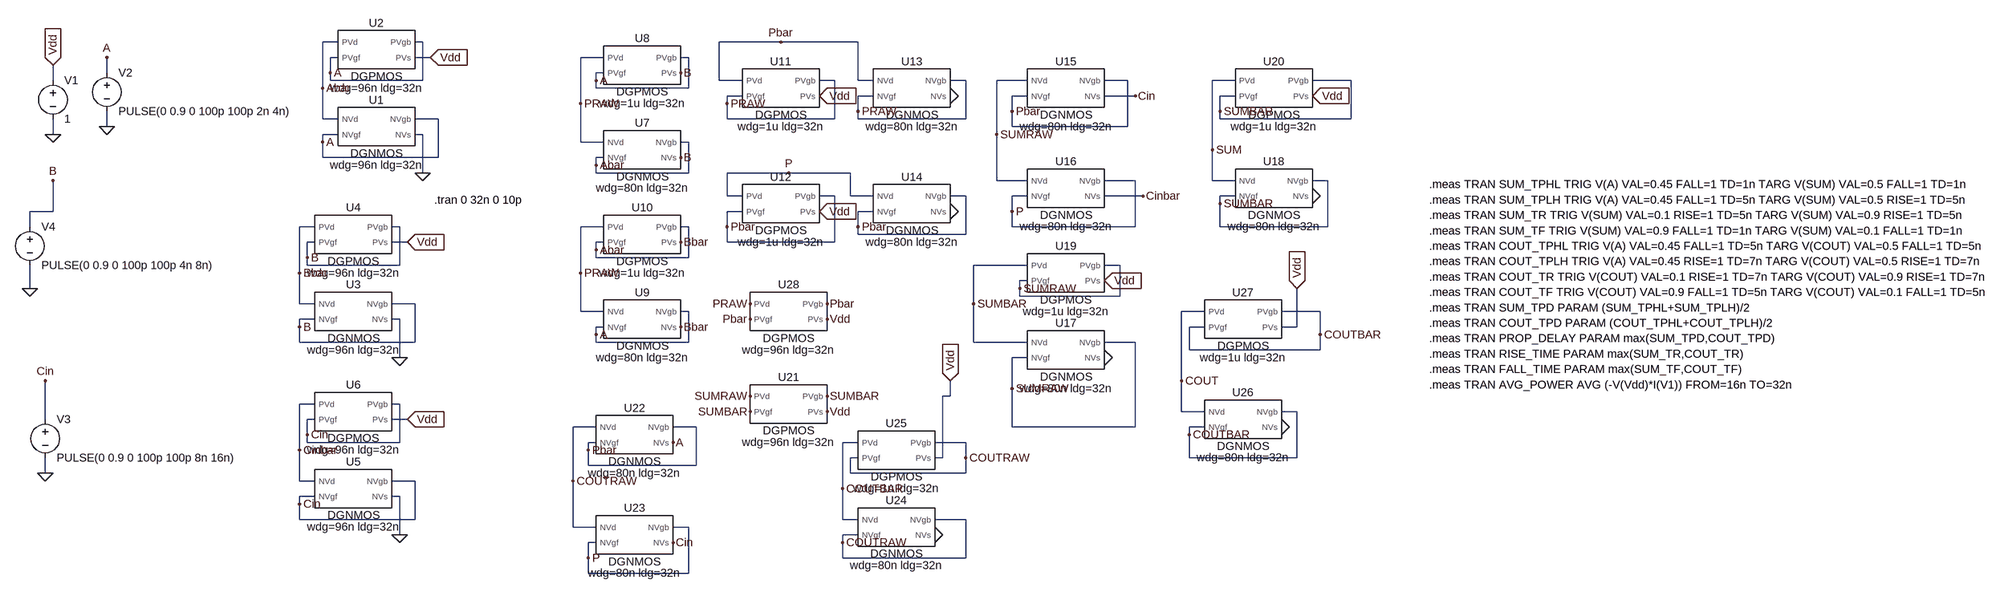
[diagram p0: schematic TG_PASS_FinFET.asc]
TG_PASS_FinFET.asc, the LTspice schematic file:
Version 4
SHEET 1 2736 1444
WIRE -2144 80 -2176 80
WIRE -1968 80 -1984 80
WIRE -944 80 -1072 80
WIRE -784 80 -944 80
WIRE -2144 112 -2160 112
WIRE -1952 112 -1984 112
WIRE -1312 112 -1360 112
WIRE -1136 112 -1152 112
WIRE -2624 144 -2624 112
WIRE -2160 144 -2160 112
WIRE -1312 144 -1328 144
WIRE -2736 160 -2736 128
WIRE -2160 160 -2160 144
WIRE -1968 160 -1968 80
WIRE -1968 160 -2160 160
WIRE -1328 160 -1328 144
WIRE -1072 160 -1072 80
WIRE -1024 160 -1072 160
WIRE -832 160 -864 160
WIRE -784 160 -784 80
WIRE -752 160 -784 160
WIRE -560 160 -592 160
WIRE -432 160 -496 160
WIRE -224 160 -272 160
WIRE 0 160 -48 160
WIRE 240 160 160 160
WIRE -2176 176 -2176 80
WIRE -1328 176 -1328 160
WIRE -1136 176 -1136 112
WIRE -1136 176 -1328 176
WIRE -1024 192 -1056 192
WIRE -752 192 -784 192
WIRE -432 192 -464 192
WIRE -208 192 -272 192
WIRE 0 192 -32 192
WIRE -1360 208 -1360 112
WIRE -1056 208 -1056 192
WIRE -784 224 -784 192
WIRE -464 224 -464 192
WIRE -32 224 -32 192
WIRE -2176 240 -2176 176
WIRE -2144 240 -2176 240
WIRE -1936 240 -1984 240
WIRE -1056 240 -1056 208
WIRE -832 240 -832 160
WIRE -832 240 -1056 240
WIRE -784 240 -784 224
WIRE -560 240 -560 160
WIRE -560 240 -784 240
WIRE -32 240 -32 224
WIRE 240 240 240 160
WIRE 240 240 -32 240
WIRE -2624 256 -2624 224
WIRE -464 256 -464 224
WIRE -224 256 -224 160
WIRE -224 256 -464 256
WIRE -2736 272 -2736 240
WIRE -2144 272 -2176 272
WIRE -1968 272 -1984 272
WIRE -496 272 -496 160
WIRE -2176 288 -2176 272
WIRE -1360 288 -1360 208
WIRE -1312 288 -1360 288
WIRE -1136 288 -1152 288
WIRE -48 304 -48 160
WIRE -2176 320 -2176 288
WIRE -1936 320 -1936 240
WIRE -1936 320 -2176 320
WIRE -1312 320 -1328 320
WIRE -1328 336 -1328 320
WIRE -1968 352 -1968 272
WIRE -1328 352 -1328 336
WIRE -1136 352 -1136 288
WIRE -1136 352 -1328 352
WIRE -928 352 -1056 352
WIRE -800 352 -928 352
WIRE -496 368 -496 272
WIRE -432 368 -496 368
WIRE -208 368 -272 368
WIRE -48 368 -48 304
WIRE 0 368 -48 368
WIRE 192 368 160 368
WIRE -1056 400 -1056 352
WIRE -1024 400 -1056 400
WIRE -832 400 -864 400
WIRE -800 400 -800 352
WIRE -752 400 -800 400
WIRE -560 400 -592 400
WIRE -432 400 -464 400
WIRE -192 400 -272 400
WIRE 0 400 -32 400
WIRE -32 416 -32 400
WIRE -2736 432 -2736 368
WIRE -2736 432 -2784 432
WIRE -1024 432 -1056 432
WIRE -752 432 -784 432
WIRE -464 432 -464 400
WIRE -2784 464 -2784 432
WIRE -2192 464 -2224 464
WIRE -2016 464 -2032 464
WIRE -1312 464 -1360 464
WIRE -1136 464 -1152 464
WIRE -1056 464 -1056 432
WIRE -784 464 -784 432
WIRE -464 464 -464 432
WIRE -208 464 -208 368
WIRE -208 464 -464 464
WIRE -32 464 -32 416
WIRE 192 464 192 368
WIRE 192 464 -32 464
WIRE -784 480 -784 464
WIRE -560 480 -560 400
WIRE -560 480 -784 480
WIRE -2192 496 -2208 496
WIRE -2000 496 -2032 496
WIRE -1312 496 -1328 496
WIRE -1056 496 -1056 464
WIRE -832 496 -832 400
WIRE -832 496 -1056 496
WIRE -1328 512 -1328 496
WIRE -2208 528 -2208 496
WIRE -1328 528 -1328 512
WIRE -1136 528 -1136 464
WIRE -1136 528 -1328 528
WIRE -2208 544 -2208 528
WIRE -2016 544 -2016 464
WIRE -2016 544 -2208 544
WIRE -432 544 -544 544
WIRE -240 544 -272 544
WIRE -2224 560 -2224 464
WIRE -1360 560 -1360 464
WIRE -432 576 -448 576
WIRE -2784 592 -2784 544
WIRE -448 592 -448 576
WIRE -448 608 -448 592
WIRE -240 608 -240 544
WIRE -240 608 -448 608
WIRE -2224 624 -2224 560
WIRE -2192 624 -2224 624
WIRE -1984 624 -2032 624
WIRE -544 624 -544 544
WIRE -1360 640 -1360 560
WIRE -1312 640 -1360 640
WIRE -1136 640 -1152 640
WIRE -64 640 -112 640
WIRE 176 640 96 640
WIRE -2192 656 -2224 656
WIRE -2016 656 -2032 656
WIRE -2224 672 -2224 656
WIRE -1312 672 -1328 672
WIRE -64 672 -96 672
WIRE 128 672 128 592
WIRE 128 672 96 672
WIRE -1328 688 -1328 672
WIRE 176 688 176 640
WIRE -2224 704 -2224 672
WIRE -1984 704 -1984 624
WIRE -1984 704 -2224 704
WIRE -1328 704 -1328 688
WIRE -1136 704 -1136 640
WIRE -1136 704 -1328 704
WIRE -544 704 -544 624
WIRE -432 704 -544 704
WIRE -208 704 -272 704
WIRE -96 720 -96 672
WIRE 176 720 176 688
WIRE 176 720 -96 720
WIRE -2016 736 -2016 656
WIRE -432 736 -464 736
WIRE -112 784 -112 640
WIRE -464 800 -464 736
WIRE -592 816 -592 784
WIRE -592 816 -608 816
WIRE -2192 832 -2224 832
WIRE -2016 832 -2032 832
WIRE -112 848 -112 784
WIRE -64 848 -112 848
WIRE 128 848 96 848
WIRE -2752 864 -2752 784
WIRE -2192 864 -2208 864
WIRE -2000 864 -2032 864
WIRE -1328 880 -1376 880
WIRE -1120 880 -1168 880
WIRE -464 880 -464 800
WIRE -208 880 -208 704
WIRE -208 880 -464 880
WIRE -64 880 -96 880
WIRE -2208 896 -2208 864
WIRE -96 896 -96 880
WIRE -2208 912 -2208 896
WIRE -2016 912 -2016 832
WIRE -2016 912 -2208 912
WIRE -1328 912 -1344 912
WIRE -784 912 -816 912
WIRE -560 912 -624 912
WIRE -2224 928 -2224 832
WIRE -1344 928 -1344 912
WIRE -784 944 -800 944
WIRE -608 944 -608 816
WIRE -608 944 -624 944
WIRE -560 944 -560 912
WIRE -96 944 -96 896
WIRE 128 944 128 848
WIRE 128 944 -96 944
WIRE -1344 960 -1344 928
WIRE -1120 960 -1120 880
WIRE -1120 960 -1344 960
WIRE -2752 976 -2752 944
WIRE -800 976 -800 944
WIRE -560 976 -560 944
WIRE -560 976 -800 976
WIRE -2224 992 -2224 928
WIRE -2192 992 -2224 992
WIRE -1984 992 -2032 992
WIRE -1376 992 -1376 880
WIRE -816 1008 -816 912
WIRE -2192 1024 -2224 1024
WIRE -2016 1024 -2032 1024
WIRE -2224 1040 -2224 1024
WIRE -2224 1072 -2224 1040
WIRE -1984 1072 -1984 992
WIRE -1984 1072 -2224 1072
WIRE -816 1072 -816 1008
WIRE -784 1072 -816 1072
WIRE -560 1072 -624 1072
WIRE -1376 1088 -1376 992
WIRE -1328 1088 -1376 1088
WIRE -1136 1088 -1168 1088
WIRE -2016 1104 -2016 1024
WIRE -784 1104 -816 1104
WIRE -1328 1120 -1344 1120
WIRE -816 1120 -816 1104
WIRE -1344 1152 -1344 1120
WIRE -816 1152 -816 1120
WIRE -560 1152 -560 1072
WIRE -560 1152 -816 1152
WIRE -1344 1184 -1344 1152
WIRE -1136 1184 -1136 1088
WIRE -1136 1184 -1344 1184
FLAG -1952 112 Vdd
IOPIN -1952 112 In
FLAG -1968 352 0
FLAG -2736 128 Vdd
IOPIN -2736 128 In
FLAG -2736 272 0
FLAG -2624 256 0
FLAG -2624 112 A
FLAG -2160 144 A
FLAG -2176 288 A
FLAG -2176 176 Abar
FLAG -2000 496 Vdd
IOPIN -2000 496 In
FLAG -2016 736 0
FLAG -2208 528 B
FLAG -2224 672 B
FLAG -2224 560 Bbar
FLAG -2000 864 Vdd
IOPIN -2000 864 In
FLAG -2016 1104 0
FLAG -2208 896 Cin
FLAG -2224 1040 Cin
FLAG -2224 928 Cinbar
FLAG -2784 592 0
FLAG -2752 976 0
FLAG -2736 368 B
FLAG -2752 784 Cin
FLAG -1360 208 PRAW
FLAG -1328 160 A
FLAG -1152 144 B
FLAG -1328 336 Abar
FLAG -1152 320 B
FLAG -1360 560 PRAW
FLAG -1328 512 Abar
FLAG -1152 496 Bbar
FLAG -1328 688 A
FLAG -1152 672 Bbar
FLAG -944 80 Pbar
FLAG -1056 208 PRAW
FLAG -784 224 PRAW
FLAG -864 192 Vdd
IOPIN -864 192 In
FLAG -592 192 0
FLAG -592 432 0
FLAG -1056 464 Pbar
FLAG -784 464 Pbar
FLAG -928 352 P
FLAG -864 432 Vdd
IOPIN -864 432 In
FLAG -464 224 Pbar
FLAG -464 432 P
FLAG -208 192 Cin
FLAG -192 400 Cinbar
FLAG -544 624 SUMBAR
FLAG -496 272 SUMRAW
FLAG -448 592 SUMRAW
FLAG -464 800 SUMRAW
FLAG -272 576 Vdd
IOPIN -272 576 In
FLAG -272 736 0
FLAG 160 192 Vdd
IOPIN 160 192 In
FLAG 160 400 0
FLAG -32 224 SUMBAR
FLAG -32 416 SUMBAR
FLAG -48 304 SUM
FLAG -1008 816 SUMRAW
FLAG -1008 848 SUMBAR
FLAG -848 816 SUMBAR
FLAG -848 848 Vdd
FLAG -1168 912 A
FLAG -1168 1120 Cin
FLAG -1344 928 Pbar
FLAG -1344 1152 P
FLAG -1376 992 COUTRAW
FLAG -816 1008 COUTBAR
FLAG -560 944 COUTRAW
FLAG -816 1120 COUTRAW
FLAG -592 784 Vdd
IOPIN -592 784 In
FLAG -624 1104 0
FLAG 128 592 Vdd
IOPIN 128 592 In
FLAG 96 880 0
FLAG 176 688 COUTBAR
FLAG -96 896 COUTBAR
FLAG -112 784 COUT
FLAG -1008 624 PRAW
FLAG -1008 656 Pbar
FLAG -848 624 Pbar
FLAG -848 656 Vdd
SYMBOL AutoGenerated\\DGNMOS -2064 256 R0
SYMATTR InstName U1
SYMATTR SpiceLine wdg=96n ldg=32n
SYMBOL AutoGenerated\\DGPMOS -2064 96 R0
SYMATTR InstName U2
SYMATTR SpiceLine wdg=96n ldg=32n
SYMBOL voltage -2736 144 R0
WINDOW 123 0 0 Left 0
WINDOW 39 0 0 Left 0
SYMATTR InstName V1
SYMATTR Value 1
SYMBOL voltage -2624 128 R0
WINDOW 123 0 0 Left 0
WINDOW 39 0 0 Left 0
SYMATTR InstName V2
SYMATTR Value PULSE(0 0.9 0 100p 100p 2n 4n)
SYMBOL AutoGenerated\\DGNMOS -2112 640 R0
SYMATTR InstName U3
SYMATTR SpiceLine wdg=96n ldg=32n
SYMBOL AutoGenerated\\DGPMOS -2112 480 R0
SYMATTR InstName U4
SYMATTR SpiceLine wdg=96n ldg=32n
SYMBOL AutoGenerated\\DGNMOS -2112 1008 R0
SYMATTR InstName U5
SYMATTR SpiceLine wdg=96n ldg=32n
SYMBOL AutoGenerated\\DGPMOS -2112 848 R0
SYMATTR InstName U6
SYMATTR SpiceLine wdg=96n ldg=32n
SYMBOL voltage -2752 848 R0
WINDOW 123 0 0 Left 0
WINDOW 39 0 0 Left 0
SYMATTR InstName V3
SYMATTR Value PULSE(0 0.9 0 100p 100p 8n 16n)
SYMBOL voltage -2784 448 R0
WINDOW 123 0 0 Left 0
WINDOW 39 0 0 Left 0
SYMATTR InstName V4
SYMATTR Value PULSE(0 0.9 0 100p 100p 4n 8n)
SYMBOL AutoGenerated\\DGNMOS -1232 304 R0
SYMATTR InstName U7
SYMBOL AutoGenerated\\DGPMOS -1232 128 R0
SYMATTR InstName U8
SYMBOL AutoGenerated\\DGNMOS -1232 656 R0
SYMATTR InstName U9
SYMBOL AutoGenerated\\DGPMOS -1232 480 R0
SYMATTR InstName U10
SYMBOL AutoGenerated\\DGPMOS -944 176 R0
SYMATTR InstName U11
SYMBOL AutoGenerated\\DGPMOS -944 416 R0
SYMATTR InstName U12
SYMBOL AutoGenerated\\DGNMOS -672 176 R0
SYMATTR InstName U13
SYMBOL AutoGenerated\\DGNMOS -672 416 R0
SYMATTR InstName U14
SYMBOL AutoGenerated\\DGNMOS -352 176 R0
SYMATTR InstName U15
SYMBOL AutoGenerated\\DGNMOS -352 384 R0
SYMATTR InstName U16
SYMBOL AutoGenerated\\DGNMOS -352 720 R0
SYMATTR InstName U17
SYMBOL AutoGenerated\\DGNMOS 80 384 R0
SYMATTR InstName U18
SYMBOL AutoGenerated\\DGPMOS -352 560 R0
SYMATTR InstName U19
SYMBOL AutoGenerated\\DGPMOS 80 176 R0
SYMATTR InstName U20
SYMBOL AutoGenerated\\DGPMOS -928 832 R0
SYMATTR InstName U21
SYMATTR SpiceLine wdg=96n ldg=32n
SYMBOL AutoGenerated\\DGNMOS -1248 896 R0
SYMATTR InstName U22
SYMBOL AutoGenerated\\DGNMOS -1248 1104 R0
SYMATTR InstName U23
SYMBOL AutoGenerated\\DGNMOS -704 1088 R0
SYMATTR InstName U24
SYMBOL AutoGenerated\\DGPMOS -704 928 R0
SYMATTR InstName U25
SYMBOL AutoGenerated\\DGNMOS 16 864 R0
SYMATTR InstName U26
SYMBOL AutoGenerated\\DGPMOS 16 656 R0
SYMATTR InstName U27
SYMBOL AutoGenerated\\DGPMOS -928 640 R0
SYMATTR InstName U28
SYMATTR SpiceLine wdg=96n ldg=32n
TEXT -1944 408 Left 2 !.tran 0 32n 0 10p
TEXT 1448 376 Left 2 !.meas TRAN SUM_TPHL TRIG V(A) VAL=0.45 FALL=1 TD=1n TARG V(SUM) VAL=0.5 FALL=1 TD=1n
TEXT 1448 408 Left 2 !.meas TRAN SUM_TPLH TRIG V(A) VAL=0.45 FALL=1 TD=5n TARG V(SUM) VAL=0.5 RISE=1 TD=5n
TEXT 1448 440 Left 2 !.meas TRAN SUM_TR TRIG V(SUM) VAL=0.1 RISE=1 TD=5n TARG V(SUM) VAL=0.9 RISE=1 TD=5n
TEXT 1448 472 Left 2 !.meas TRAN SUM_TF TRIG V(SUM) VAL=0.9 FALL=1 TD=1n TARG V(SUM) VAL=0.1 FALL=1 TD=1n
TEXT 1448 504 Left 2 !.meas TRAN COUT_TPHL TRIG V(A) VAL=0.45 FALL=1 TD=5n TARG V(COUT) VAL=0.5 FALL=1 TD=5n
TEXT 1448 536 Left 2 !.meas TRAN COUT_TPLH TRIG V(A) VAL=0.45 RISE=1 TD=7n TARG V(COUT) VAL=0.5 RISE=1 TD=7n
TEXT 1448 568 Left 2 !.meas TRAN COUT_TR TRIG V(COUT) VAL=0.1 RISE=1 TD=7n TARG V(COUT) VAL=0.9 RISE=1 TD=7n
TEXT 1448 600 Left 2 !.meas TRAN COUT_TF TRIG V(COUT) VAL=0.9 FALL=1 TD=5n TARG V(COUT) VAL=0.1 FALL=1 TD=5n
TEXT 1448 632 Left 2 !.meas TRAN SUM_TPD PARAM (SUM_TPHL+SUM_TPLH)/2
TEXT 1448 664 Left 2 !.meas TRAN COUT_TPD PARAM (COUT_TPHL+COUT_TPLH)/2
TEXT 1448 696 Left 2 !.meas TRAN PROP_DELAY PARAM max(SUM_TPD,COUT_TPD)
TEXT 1448 728 Left 2 !.meas TRAN RISE_TIME PARAM max(SUM_TR,COUT_TR)
TEXT 1448 760 Left 2 !.meas TRAN FALL_TIME PARAM max(SUM_TF,COUT_TF)
TEXT 1448 792 Left 2 !.meas TRAN AVG_POWER AVG (-V(Vdd)*I(V1)) FROM=16n TO=32n

The netlist it stands for:
* TG_PASS_FinFET.asc
XU1 Abar A A 0 DGNMOS wdg=96n ldg=32n  ; pins NVd NVgf NVgb NVs
XU2 Abar A A Vdd DGPMOS wdg=96n ldg=32n  ; pins PVd PVgf PVgb PVs
V1 Vdd 0 1
V2 A 0 PULSE(0 0.9 0 100p 100p 2n 4n)
XU3 Bbar B B 0 DGNMOS wdg=96n ldg=32n  ; pins NVd NVgf NVgb NVs
XU4 Bbar B B Vdd DGPMOS wdg=96n ldg=32n  ; pins PVd PVgf PVgb PVs
XU5 Cinbar Cin Cin 0 DGNMOS wdg=96n ldg=32n  ; pins NVd NVgf NVgb NVs
XU6 Cinbar Cin Cin Vdd DGPMOS wdg=96n ldg=32n  ; pins PVd PVgf PVgb PVs
V3 Cin 0 PULSE(0 0.9 0 100p 100p 8n 16n)
V4 B 0 PULSE(0 0.9 0 100p 100p 4n 8n)
XU7 PRAW Abar Abar B DGNMOS wdg=80n ldg=32n  ; pins NVd NVgf NVgb NVs
XU8 PRAW A A B DGPMOS wdg=1u ldg=32n  ; pins PVd PVgf PVgb PVs
XU9 PRAW A A Bbar DGNMOS wdg=80n ldg=32n  ; pins NVd NVgf NVgb NVs
XU10 PRAW Abar Abar Bbar DGPMOS wdg=1u ldg=32n  ; pins PVd PVgf PVgb PVs
XU11 Pbar PRAW PRAW Vdd DGPMOS wdg=1u ldg=32n  ; pins PVd PVgf PVgb PVs
XU12 P Pbar Pbar Vdd DGPMOS wdg=1u ldg=32n  ; pins PVd PVgf PVgb PVs
XU13 Pbar PRAW PRAW 0 DGNMOS wdg=80n ldg=32n  ; pins NVd NVgf NVgb NVs
XU14 P Pbar Pbar 0 DGNMOS wdg=80n ldg=32n  ; pins NVd NVgf NVgb NVs
XU15 SUMRAW Pbar Pbar Cin DGNMOS wdg=80n ldg=32n  ; pins NVd NVgf NVgb NVs
XU16 SUMRAW P P Cinbar DGNMOS wdg=80n ldg=32n  ; pins NVd NVgf NVgb NVs
XU17 SUMBAR SUMRAW SUMRAW 0 DGNMOS wdg=80n ldg=32n  ; pins NVd NVgf NVgb NVs
XU18 SUM SUMBAR SUMBAR 0 DGNMOS wdg=80n ldg=32n  ; pins NVd NVgf NVgb NVs
XU19 SUMBAR SUMRAW SUMRAW Vdd DGPMOS wdg=1u ldg=32n  ; pins PVd PVgf PVgb PVs
XU20 SUM SUMBAR SUMBAR Vdd DGPMOS wdg=1u ldg=32n  ; pins PVd PVgf PVgb PVs
XU21 SUMRAW SUMBAR SUMBAR Vdd DGPMOS wdg=96n ldg=32n  ; pins PVd PVgf PVgb PVs
XU22 COUTRAW Pbar Pbar A DGNMOS wdg=80n ldg=32n  ; pins NVd NVgf NVgb NVs
XU23 COUTRAW P P Cin DGNMOS wdg=80n ldg=32n  ; pins NVd NVgf NVgb NVs
XU24 COUTBAR COUTRAW COUTRAW 0 DGNMOS wdg=80n ldg=32n  ; pins NVd NVgf NVgb NVs
XU25 COUTBAR COUTRAW COUTRAW Vdd DGPMOS wdg=1u ldg=32n  ; pins PVd PVgf PVgb PVs
XU26 COUT COUTBAR COUTBAR 0 DGNMOS wdg=80n ldg=32n  ; pins NVd NVgf NVgb NVs
XU27 COUT COUTBAR COUTBAR Vdd DGPMOS wdg=1u ldg=32n  ; pins PVd PVgf PVgb PVs
XU28 PRAW Pbar Pbar Vdd DGPMOS wdg=96n ldg=32n  ; pins PVd PVgf PVgb PVs
.tran 0 32n 0 10p
.meas TRAN SUM_TPHL TRIG V(A) VAL=0.45 FALL=1 TD=1n TARG V(SUM) VAL=0.5 FALL=1 TD=1n
.meas TRAN SUM_TPLH TRIG V(A) VAL=0.45 FALL=1 TD=5n TARG V(SUM) VAL=0.5 RISE=1 TD=5n
.meas TRAN SUM_TR TRIG V(SUM) VAL=0.1 RISE=1 TD=5n TARG V(SUM) VAL=0.9 RISE=1 TD=5n
.meas TRAN SUM_TF TRIG V(SUM) VAL=0.9 FALL=1 TD=1n TARG V(SUM) VAL=0.1 FALL=1 TD=1n
.meas TRAN COUT_TPHL TRIG V(A) VAL=0.45 FALL=1 TD=5n TARG V(COUT) VAL=0.5 FALL=1 TD=5n
.meas TRAN COUT_TPLH TRIG V(A) VAL=0.45 RISE=1 TD=7n TARG V(COUT) VAL=0.5 RISE=1 TD=7n
.meas TRAN COUT_TR TRIG V(COUT) VAL=0.1 RISE=1 TD=7n TARG V(COUT) VAL=0.9 RISE=1 TD=7n
.meas TRAN COUT_TF TRIG V(COUT) VAL=0.9 FALL=1 TD=5n TARG V(COUT) VAL=0.1 FALL=1 TD=5n
.meas TRAN SUM_TPD PARAM (SUM_TPHL+SUM_TPLH)/2
.meas TRAN COUT_TPD PARAM (COUT_TPHL+COUT_TPLH)/2
.meas TRAN PROP_DELAY PARAM max(SUM_TPD,COUT_TPD)
.meas TRAN RISE_TIME PARAM max(SUM_TR,COUT_TR)
.meas TRAN FALL_TIME PARAM max(SUM_TF,COUT_TF)
.meas TRAN AVG_POWER AVG (-V(Vdd)*I(V1)) FROM=16n TO=32n
.lib C:\Users\et221\OneDrive\Documents\LTspice\2G-FINFET-LTSPICE\FINFET-DG-32nm\32nm_finfet.sp~
.backanno
.end